# Altium schematic sheet stm32f411.SchDoc
size A3; SheetNumber: 18; SheetTotal: 19
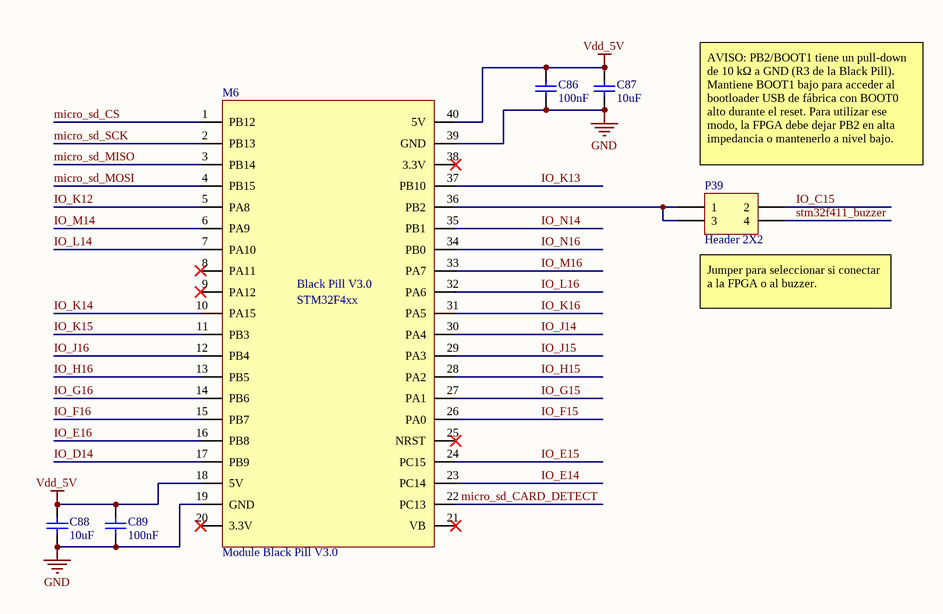
[diagram p0: stm32f411.SchDoc]

## Parts
C86  value 100nF  [capacitor 0603]  (hidden comment: Ceramic capacitor)
C87  value 10uF  [capacitor 0603]  (hidden comment: ceramic capacitor)
C88  value 10uF  [capacitor 0603]  (hidden comment: ceramic capacitor)
C89  value 100nF  [capacitor 0603]  (hidden comment: Ceramic capacitor)
M6  Module Black Pill V3.0  [module black pill v3.0]
P39  Header 2X2  [HDR2X2]

## Nets
GND: C86.1 C87.1 C88.1 C89.1 M6.19(GND) M6.39(GND)
Vdd_5V: C86.2 C87.2 C88.2 C89.2 M6.18(5V) M6.40(5V)
IO_C15: P39.2
IO_D14: M6.17(PB9)
IO_E14: M6.23(PC14)
IO_E15: M6.24(PC15)
IO_E16: M6.16(PB8)
IO_F15: M6.26(PA0)
IO_F16: M6.15(PB7)
IO_G15: M6.27(PA1)
IO_G16: M6.14(PB6)
IO_H15: M6.28(PA2)
IO_H16: M6.13(PB5)
IO_J14: M6.30(PA4)
IO_J15: M6.29(PA3)
IO_J16: M6.12(PB4)
IO_K12: M6.5(PA8)
IO_K13: M6.37(PB10)
IO_K14: M6.10(PA15)
IO_K15: M6.11(PB3)
IO_K16: M6.31(PA5)
IO_L14: M6.7(PA10)
IO_L16: M6.32(PA6)
IO_M14: M6.6(PA9)
IO_M16: M6.33(PA7)
IO_N14: M6.35(PB1)
IO_N16: M6.34(PB0)
micro_sd_CARD_DETECT: M6.22(PC13)
micro_sd_CS: M6.1(PB12)
micro_sd_MISO: M6.3(PB14)
micro_sd_MOSI: M6.4(PB15)
micro_sd_SCK: M6.2(PB13)
stm32f411_buzzer: P39.4
NetM6_36: M6.36(PB2) P39.1 P39.3

Not connected (* = marked no-connect by the designer): M6 8(PA11)* 9(PA12)* 20(3.3V)* 21(VB)* 25(NRST)* 38(3.3V)*

## Notes on the sheet
- (near P39) AVISO: PB2/BOOT1 tiene un pull-down de 10 kΩ a GND (R3 de la Black Pill). Mantiene BOOT1 bajo para acceder al bootloader USB de fábrica con BOOT0 alto durante el reset. Para utilizar ese modo, la FPGA debe dejar PB2 en alta impedancia o mantenerlo a nivel bajo.
- (near P39) Jumper para seleccionar si conectar a la FPGA o al buzzer.
- (in symbol Module Black Pill V3.0) Black Pill V3.0; STM32F4xx

## Library data of the parts
C86 C89 = Ceramic capacitor: Multilayer ceramic capacitor; V: 50; LCSC part: C14663; Package: 0603
C87 C88 = ceramic capacitor: Multilayer ceramic capacitor; V: 6.3; LCSC part: C1691; Package: 0603
M6 = Module Black Pill V3.0: Module Black Pill V3.0 / STM32F4xx
P39 = Header 2X2: Header, 2-Pin, Dual row; LatestRevisionDate: 17-Jul-2002; LatestRevisionNote: Re-released for DXP Platform.; Publisher: Altium Limited